# Altium schematic sheet Robot_POWER.schdoc
size 594 x 420 mm; Symbol: Sheet-Symbol_A4; Device: Sheet-Symbol_A4; Company: 嘉立创EDA; Version: V1.0; Page Size: A4; @Project Name: Power_Board2.0_布局; @Page Count: 1; @Update Date: 2025-11-04; @Create Date: 2025-11-04; @Schematic Name: Schematic1_1; @Page No: 1; @Page Name: P1; Width: 1655; Height: 1170; @Board Name: Board1; Blade Width: 10; @Create Time: 12:11:19; @Update Time: 19:38:18; Region Start: 1; X Region Count: 6; Y Region Count: 4; Title Block Position: 3; SheetNumber: 1; SheetTotal: 1
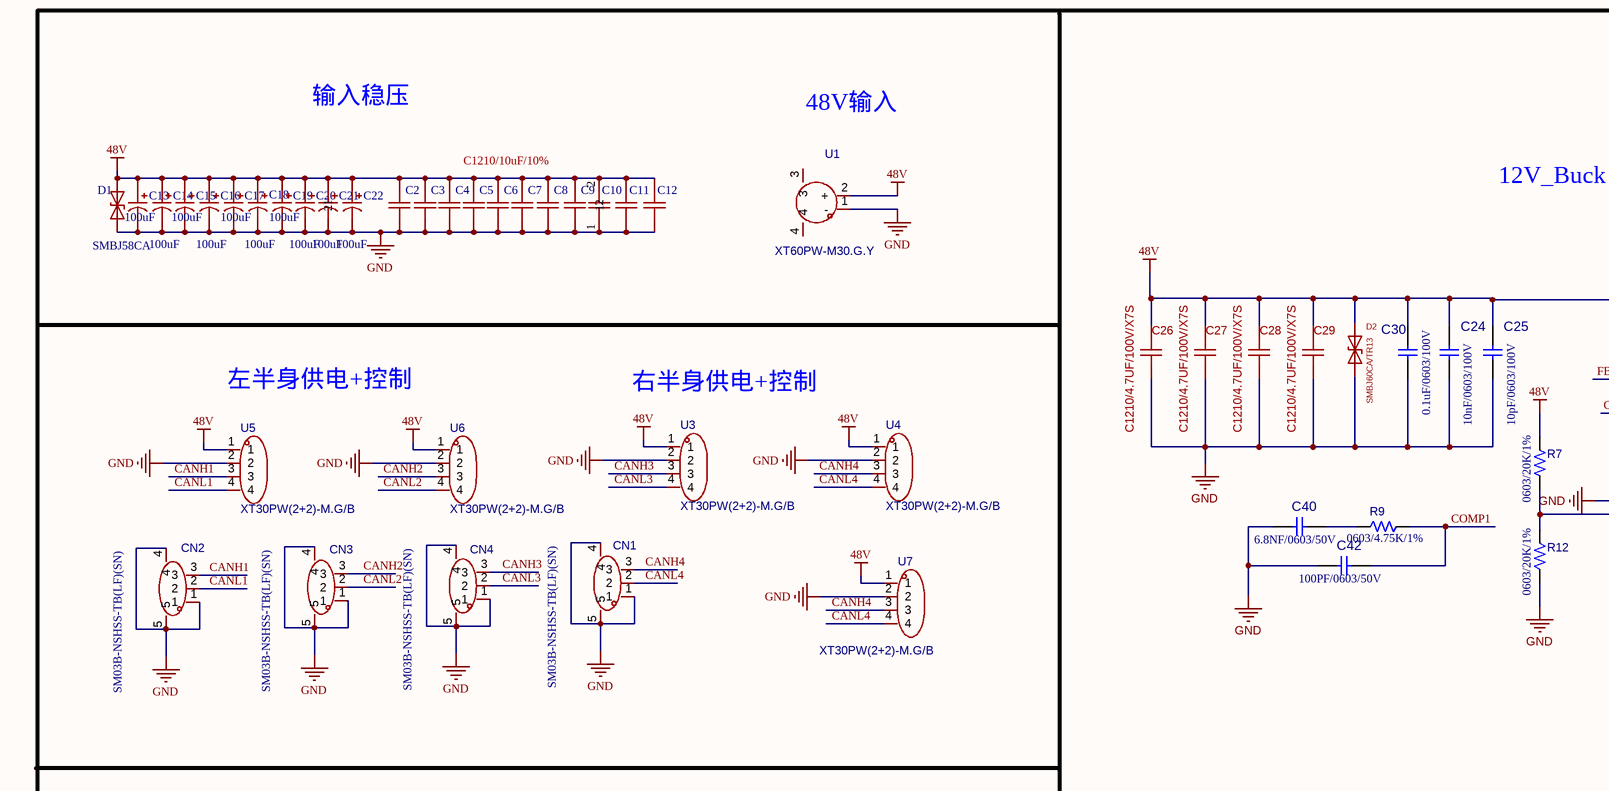
[diagram p0: Robot_POWER.schdoc, top left]
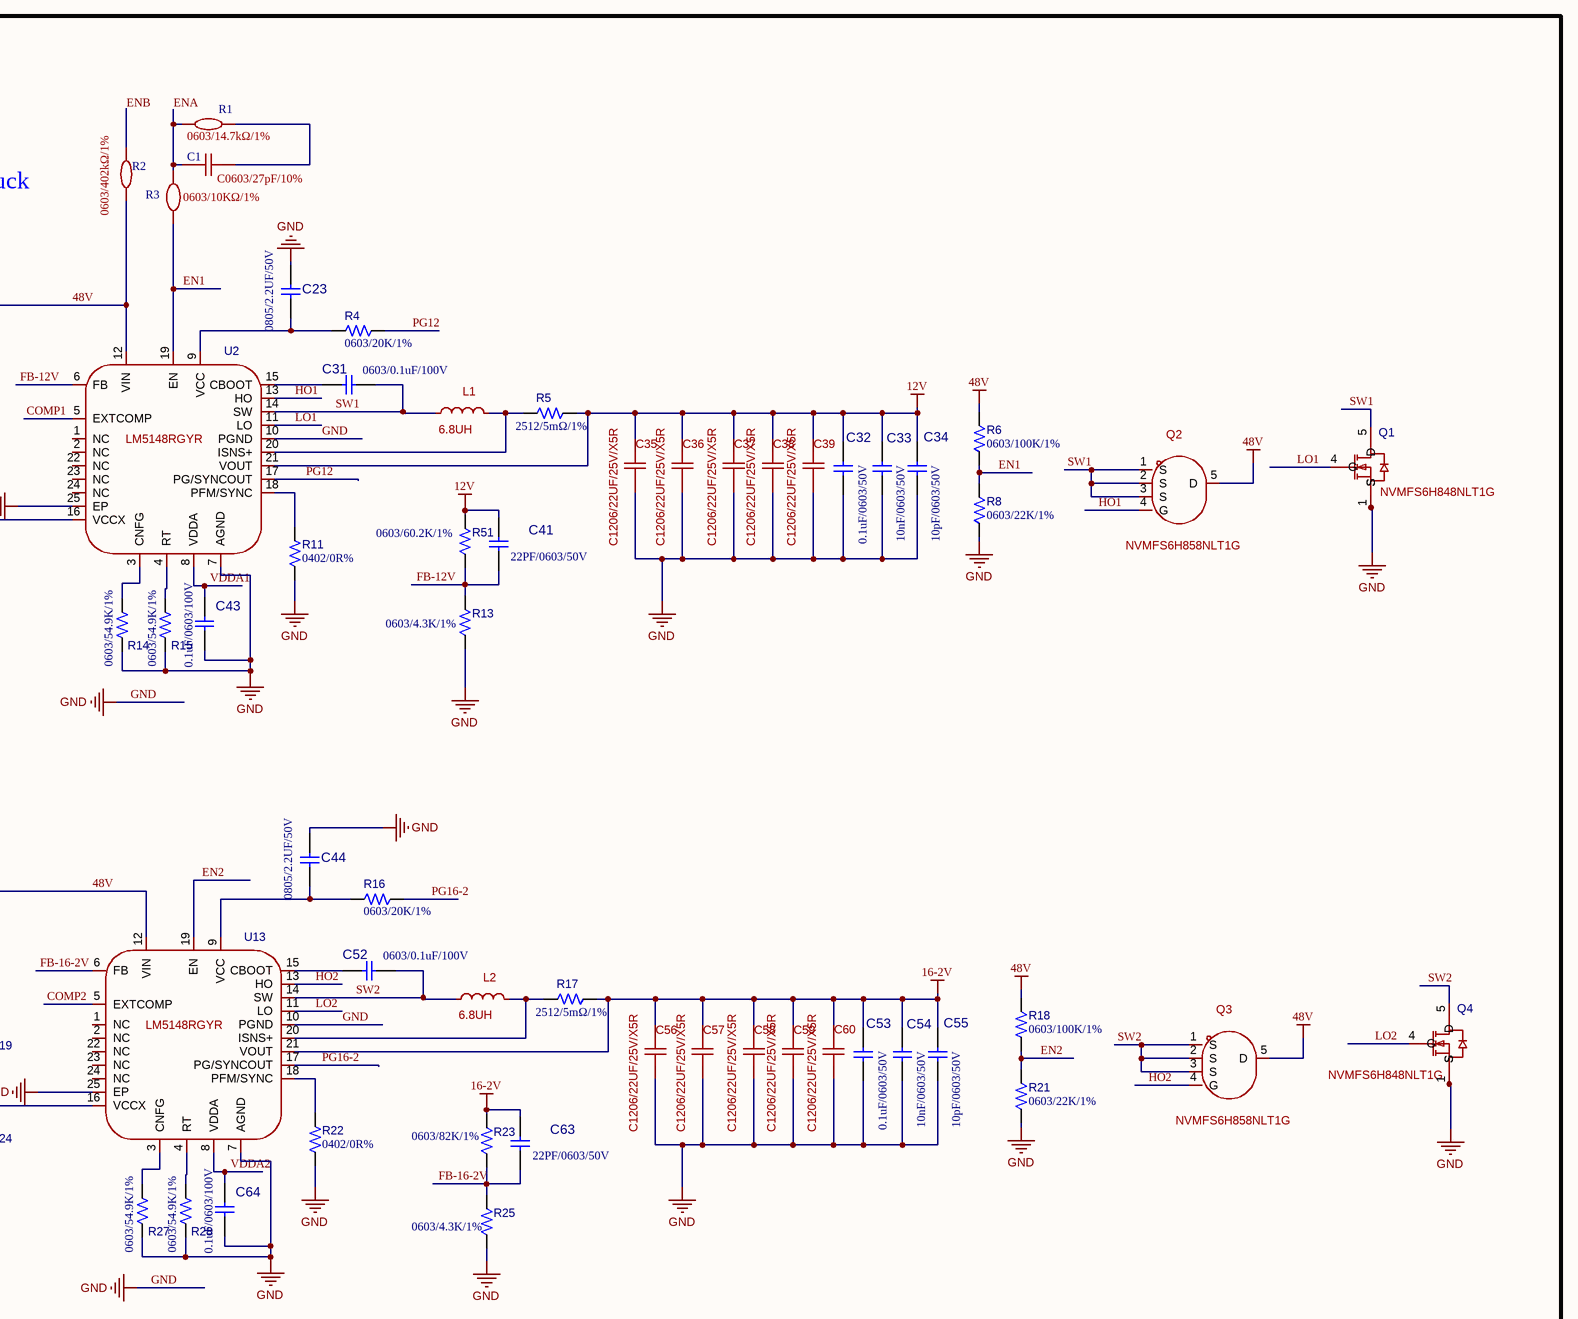
[diagram p1: Robot_POWER.schdoc, top right]
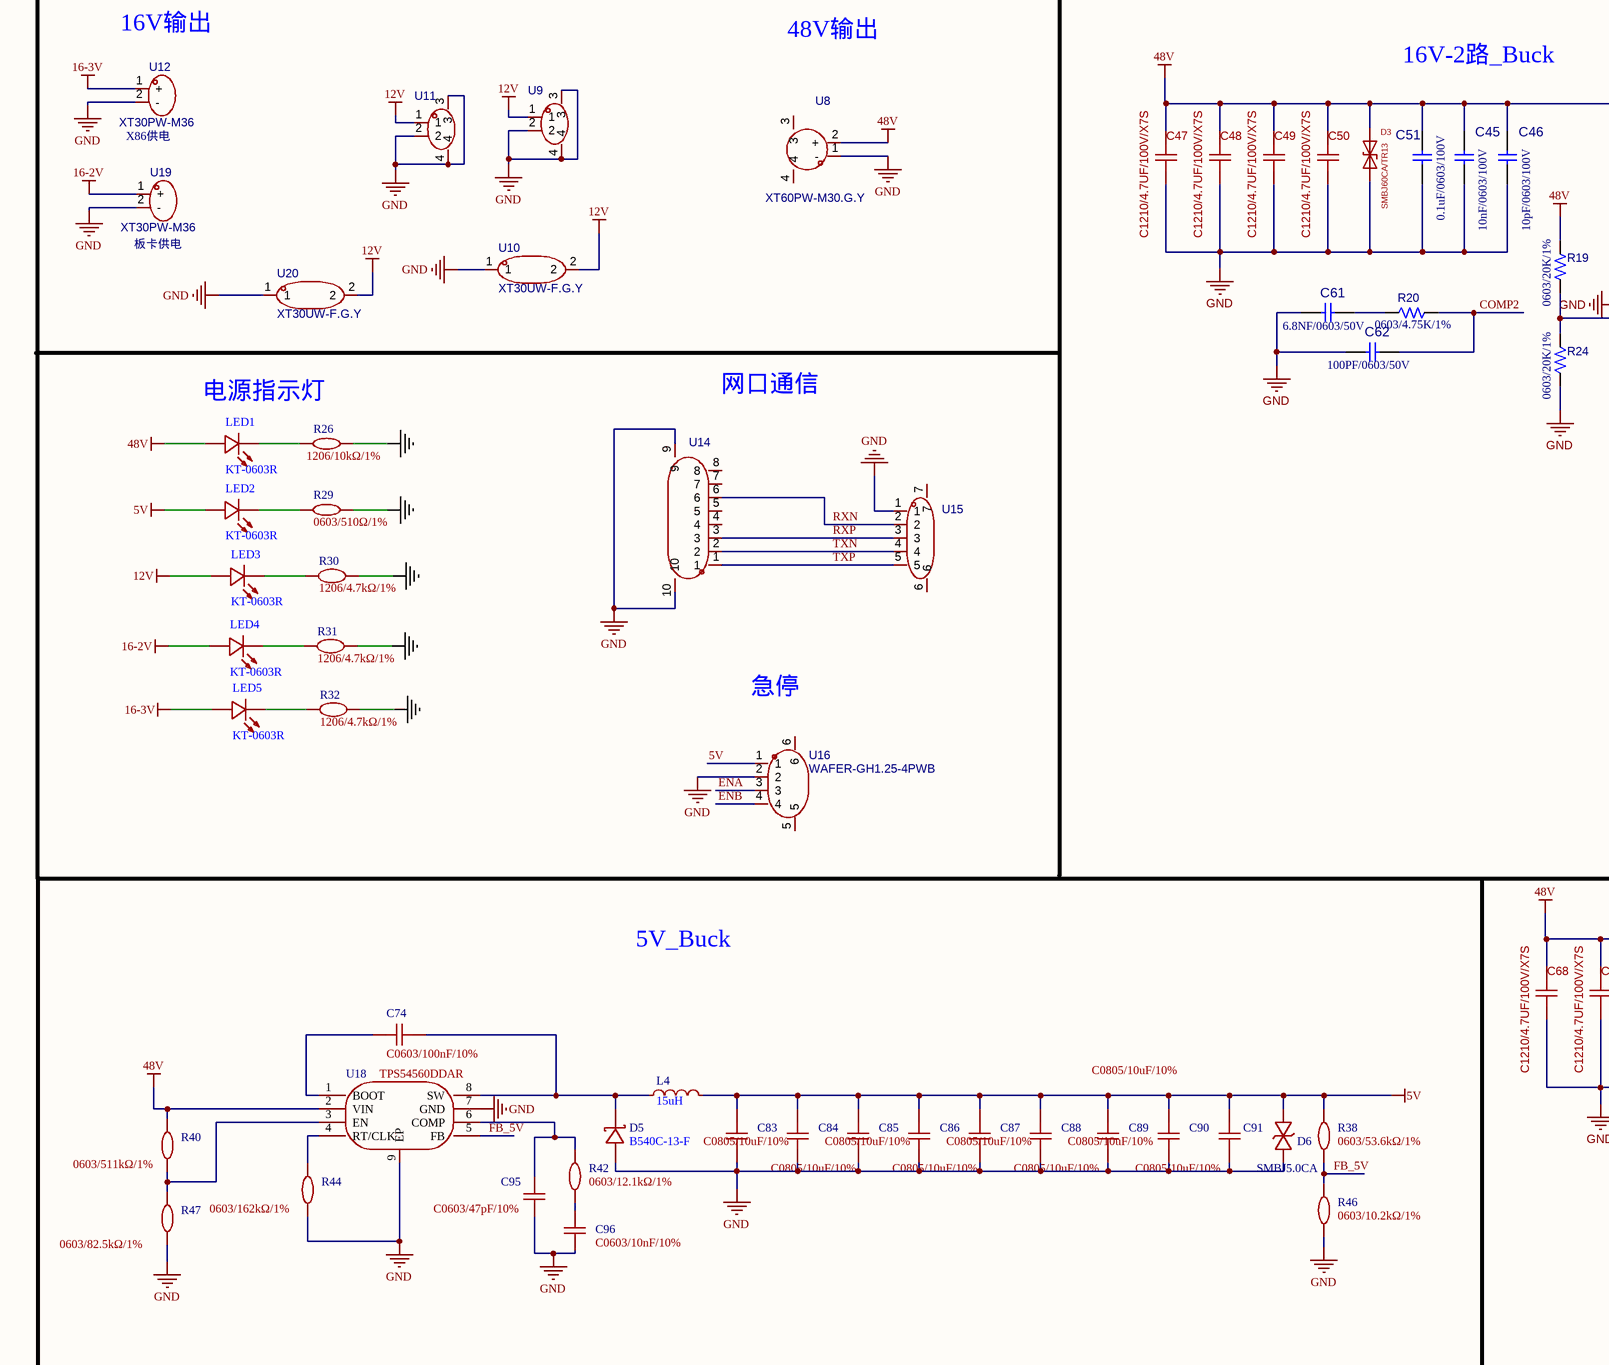
[diagram p2: Robot_POWER.schdoc, bottom left]
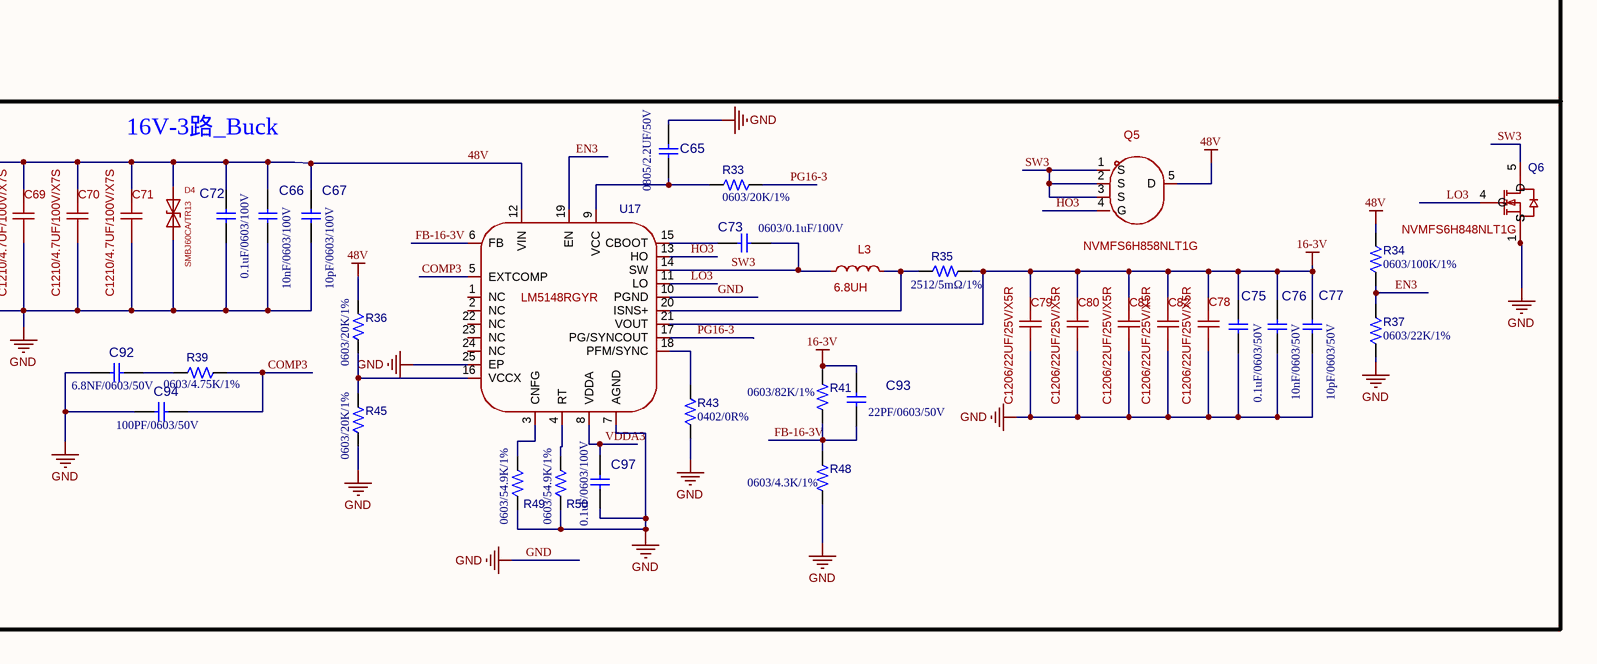
[diagram p3: Robot_POWER.schdoc, bottom right]

## Parts
C1  C0603/27pF/10%  [C0603]
C2  C1210/10uF/10%  [C1210]  (value not drawn)
C3  C1210/10uF/10%  [C1210]  (value not drawn)
C4  C1210/10uF/10%  [C1210]  (value not drawn)
C5  C1210/10uF/10%  [C1210]  (value not drawn)
C6  C1210/10uF/10%  [C1210]  (value not drawn)
C7  C1210/10uF/10%  [C1210]  (value not drawn)
C8  C1210/10uF/10%  [C1210]
C9  C1210/10uF/10%  [c1210]  (value not drawn)
C10  C1210/10uF/10%  [C1210]  (value not drawn)
C11  C1210/10uF/10%  [C1210]  (value not drawn)
C12  C1210/10uF/10%  [C1210]  (value not drawn)
C13  100uF  [CAP-TH_BD10.0-P5.00-D0.6-FD_2]
C14  100uF  [CAP-TH_BD10.0-P5.00-D0.6-FD_2]
C15  100uF  [CAP-TH_BD10.0-P5.00-D0.6-FD_2]
C16  100uF  [CAP-TH_BD10.0-P5.00-D0.6-FD_2]
C17  100uF  [CAP-TH_BD10.0-P5.00-D0.6-FD_2]
C18  100uF  [CAP-TH_BD10.0-P5.00-D0.6-FD_2]
C19  100uF  [CAP-TH_BD10.0-P5.00-D0.6-FD_2]
C20  100uF  [CAP-TH_BD10.0-P5.00-D0.6-FD_2]
C21  100uF  [CAP-TH_BD10.0-P5.00-D0.6-FD_2]
C22  100uF  [CAP-TH_BD10.0-P5.00-D0.6-FD_2]
C23  0805/2.2UF/50V  [C0805]
C24  10nF/0603/100V  [C0603]
C25  10pF/0603/100V  [C0603]
C26  C1210/4.7UF/100V/X7S  [C1210]
C27  C1210/4.7UF/100V/X7S  [C1210]
C28  C1210/4.7UF/100V/X7S  [C1210]
C29  C1210/4.7UF/100V/X7S  [C1210]
C30  0.1uF/0603/100V  [C0603]
C31  0603/0.1uF/100V  [C0402]
C32  0.1uF/0603/50V  [C0603]
C33  10nF/0603/50V  [C0603]
C34  10pF/0603/50V  [C0603]
C35  C1206/22UF/25V/X5R  [C1206]
C36  C1206/22UF/25V/X5R  [C1206]
C37  C1206/22UF/25V/X5R  [C1206]
C38  C1206/22UF/25V/X5R  [C1206]
C39  C1206/22UF/25V/X5R  [C1206]
C40  6.8NF/0603/50V  [C0603]
C41  22PF/0603/50V  [C0603]
C42  100PF/0603/50V  [C0603]
C43  0.1uF/0603/100V  [C0603]
C44  0805/2.2UF/50V  [C0805]
C45  10nF/0603/100V  [C0603]
C46  10pF/0603/100V  [C0603]
C47  C1210/4.7UF/100V/X7S  [C1210]
C48  C1210/4.7UF/100V/X7S  [C1210]
C49  C1210/4.7UF/100V/X7S  [C1210]
C50  C1210/4.7UF/100V/X7S  [C1210]
C51  0.1uF/0603/100V  [C0603]
C52  0603/0.1uF/100V  [C0402]
C53  0.1uF/0603/50V  [C0603]
C54  10nF/0603/50V  [C0603]
C55  10pF/0603/50V  [C0603]
C56  C1206/22UF/25V/X5R  [C1206]
C57  C1206/22UF/25V/X5R  [C1206]
C58  C1206/22UF/25V/X5R  [C1206]
C59  C1206/22UF/25V/X5R  [C1206]
C60  C1206/22UF/25V/X5R  [C1206]
C61  6.8NF/0603/50V  [C0603]
C62  100PF/0603/50V  [C0603]
C63  22PF/0603/50V  [C0603]
C64  0.1uF/0603/100V  [C0603]
C65  0805/2.2UF/50V  [C0805]
C66  10nF/0603/100V  [C0603]
C67  10pF/0603/100V  [C0603]
C68  C1210/4.7UF/100V/X7S  [C1210]
C69  C1210/4.7UF/100V/X7S  [C1210]
C70  C1210/4.7UF/100V/X7S  [C1210]
C71  C1210/4.7UF/100V/X7S  [C1210]
C72  0.1uF/0603/100V  [C0603]
C73  0603/0.1uF/100V  [C0402]
C74  C0603/100nF/10%  [C0603]
C75  0.1uF/0603/50V  [C0603]
C76  10nF/0603/50V  [C0603]
C77  10pF/0603/50V  [C0603]
C78  C1206/22UF/25V/X5R  [C1206]
C79  C1206/22UF/25V/X5R  [C1206]
C80  C1206/22UF/25V/X5R  [C1206]
C81  C1206/22UF/25V/X5R  [C1206]
C82  C1206/22UF/25V/X5R  [C1206]
C83  C0805/10uF/10%  [C0805]
C84  C0805/10uF/10%  [C0805]
C85  C0805/10uF/10%  [C0805]
C86  C0805/10uF/10%  [C0805]
C87  C0805/10uF/10%  [C0805]
C88  C0805/10uF/10%  [C0805]
C89  C0805/10uF/10%  [C0805]
C90  C0805/10uF/10%  [C0805]
C91  C0805/10uF/10%  [C0805]
C92  6.8NF/0603/50V  [C0603]
C93  22PF/0603/50V  [C0603]
C94  100PF/0603/50V  [C0603]
C95  C0603/47pF/10%  [C0603]
C96  C0603/10nF/10%  [C0603]
C97  0.1uF/0603/100V  [C0603]
CN1  SM03B-NSHSS-TB(LF)(SN)  [CONN-SMD_3P-P1.00_BM03B-NSHSS-TBT]  (value not drawn)
CN2  SM03B-NSHSS-TB(LF)(SN)  [CONN-SMD_3P-P1.00_BM03B-NSHSS-TBT]  (value not drawn)
CN3  SM03B-NSHSS-TB(LF)(SN)  [CONN-SMD_3P-P1.00_BM03B-NSHSS-TBT]  (value not drawn)
CN4  SM03B-NSHSS-TB(LF)(SN)  [CONN-SMD_3P-P1.00_BM03B-NSHSS-TBT]  (value not drawn)
D1  SMBJ58CA  [SMB_L4.5-W3.6-LS5.2-BI]
D2  SMBJ60CA/TR13  [SMB_L4.3-W3.6-LS5.4-BI]
D3  SMBJ60CA/TR13  [SMB_L4.3-W3.6-LS5.4-BI]
D4  SMBJ60CA/TR13  [SMB_L4.3-W3.6-LS5.4-BI]
D5  B540C-13-F  [SMC_L7.1-W6.2-LS8.1-RD]
D6  SMBJ5.0CA  [SMB_L4.5-W3.6-LS5.2-BI]
L1  6.8UH  [IND-SMD_L12.8-W12.8-LS13.8_CYA1265]
L2  6.8UH  [IND-SMD_L12.8-W12.8-LS13.8_CYA1265]
L3  6.8UH  [IND-SMD_L12.8-W12.8-LS13.8_CYA1265]
L4  15uH  [IND-SMD_L7.0-W6.6]
LED1  KT-0603R  [LED0603-RD_RED]
LED2  KT-0603R  [LED0603-RD_RED]
LED3  KT-0603R  [LED0603-RD_RED]
LED4  KT-0603R  [LED0603-RD_RED]
LED5  KT-0603R  [LED0603-RD_RED]
Q1  NVMFS6H848NLT1G  [DFN-5_L4.9-W5.9-P1.27-LS6.2-BL]
Q2  NVMFS6H858NLT1G  [DFN-5_L4.9-W5.9-P1.27-LS6.2-BL]
Q3  NVMFS6H858NLT1G  [DFN-5_L4.9-W5.9-P1.27-LS6.2-BL]
Q4  NVMFS6H848NLT1G  [DFN-5_L4.9-W5.9-P1.27-LS6.2-BL]
Q5  NVMFS6H858NLT1G  [DFN-5_L4.9-W5.9-P1.27-LS6.2-BL]
Q6  NVMFS6H848NLT1G  [DFN-5_L4.9-W5.9-P1.27-LS6.2-BL]
R1  0603/14.7kΩ/1%  [R0603]
R2  0603/402kΩ/1%  [R0603]
R3  0603/10KΩ/1%  [R0603]
R4  0603/20K/1%  [R0603]
R5  2512/5mΩ/1%  [R2512]
R6  0603/100K/1%  [R0603]
R7  0603/20K/1%  [R0603]
R8  0603/22K/1%  [R0603]
R9  0603/4.75K/1%  [R0603]
R11  0402/0R%  [R0402]
R12  0603/20K/1%  [R0603]
R13  0603/4.3K/1%  [R0603]
R14  0603/54.9K/1%  [R0603]
R15  0603/54.9K/1%  [R0603]
R16  0603/20K/1%  [R0603]
R17  2512/5mΩ/1%  [R2512]
R18  0603/100K/1%  [R0603]
R19  0603/20K/1%  [R0603]
R20  0603/4.75K/1%  [R0603]
R21  0603/22K/1%  [R0603]
R22  0402/0R%  [R0402]
R23  0603/82K/1%  [R0603]
R24  0603/20K/1%  [R0603]
R25  0603/4.3K/1%  [R0603]
R26  1206/10kΩ/1%  [R1206]
R27  0603/54.9K/1%  [R0603]
R28  0603/54.9K/1%  [R0603]
R29  0603/510Ω/1%  [R0603]
R30  1206/4.7kΩ/1%  [R1206]
R31  1206/4.7kΩ/1%  [R1206]
R32  1206/4.7kΩ/1%  [R1206]
R33  0603/20K/1%  [R0603]
R34  0603/100K/1%  [R0603]
R35  2512/5mΩ/1%  [R2512]
R36  0603/20K/1%  [R0603]
R37  0603/22K/1%  [R0603]
R38  0603/53.6kΩ/1%  [R0603]
R39  0603/4.75K/1%  [R0603]
R40  0603/511kΩ/1%  [R0603]
R41  0603/82K/1%  [R0603]
R42  0603/12.1kΩ/1%  [R0603]
R43  0402/0R%  [R0402]
R44  0603/162kΩ/1%  [R0603]
R45  0603/20K/1%  [R0603]
R46  0603/10.2kΩ/1%  [R0603]
R47  0603/82.5kΩ/1%  [R0603]
R48  0603/4.3K/1%  [R0603]
R49  0603/54.9K/1%  [R0603]
R50  0603/54.9K/1%  [R0603]
R51  0603/60.2K/1%  [R0603]
U1  XT60PW-M30.G.Y  [CONN-TH_XT60PW-M]
U2  LM5148RGYR  [VQFN-24_L5.5-W3.5-P0.50-BL-EP-2]
U3  XT30PW(2+2)-M.G/B  [CONN-TH_4P-XT30PW-M]
U4  XT30PW(2+2)-M.G/B  [CONN-TH_4P-XT30PW-M]
U5  XT30PW(2+2)-M.G/B  [CONN-TH_4P-XT30PW-M]
U6  XT30PW(2+2)-M.G/B  [CONN-TH_4P-XT30PW-M]
U7  XT30PW(2+2)-M.G/B  [CONN-TH_4P-XT30PW-M]
U8  XT60PW-M30.G.Y  [CONN-TH_XT60PW-M]
U9  CONN-SMD_2053380002  [CONN-SMD_2053380002]  (value not drawn)
U10  XT30UW-F.G.Y  [CONN-TH_XT30UW-F.G.Y]
U11  CONN-SMD_2053380002  [CONN-SMD_2053380002]  (value not drawn)
U12  XT30PW-M36  [CONN-TH_2P-P5.00_XT30PW-M36]
U13  LM5148RGYR  [VQFN-24_L5.5-W3.5-P0.50-BL-EP-2]
U14  bx-ph2.0-8plt  [CONN-SMD_8P-P2.00_BX-PH2.0-8PLT]  (value not drawn)
U15  BX-SH1.0-5PLT  [CONN-SMD_5P-P1.00_BX-SH1.0-5PLT]  (value not drawn)
U16  WAFER-GH1.25-4PWB  [CONN-SMD_4P-P1.25_XUNPU_WAFER-GH1.25-4PWB]
U17  LM5148RGYR  [VQFN-24_L5.5-W3.5-P0.50-BL-EP-2]
U18  TPS54560DDAR  [SOIC-8_L5.0-W4.0-P1.27-LS6.0-BL-EP2.0]
U19  XT30PW-M36  [CONN-TH_2P-P5.00_XT30PW-M36]
U20  XT30UW-F.G.Y  [CONN-TH_XT30UW-F.G.Y]

## Nets
5V: C83.2 C84.2 C85.2 C86.2 C87.2 C88.2 C89.2 C90.2 C91.2 D6.2 L4.2 LED2.2(A) R38.2 U16.1
12V: C32.2 C33.2 C34.2 C35.1 C36.1 C37.1 C38.1 C39.1 C41.1 LED3.2(A) R5.1 R51.1 U2.21(VOUT) U9.1 U10.2 U11.1 U20.2
16-2V: C53.2 C54.2 C55.2 C56.1 C57.1 C58.1 C59.1 C60.1 C63.1 LED4.2(A) R17.1 R23.1 U13.21(VOUT) U19.1(+)
16-3V: C75.2 C76.2 C77.2 C78.1 C79.1 C80.1 C81.1 C82.1 C93.1 LED5.2(A) R35.1 R41.1 U12.1(+) U17.21(VOUT)
48V: C2.2 C3.2 C4.2 C5.2 C6.2 C7.2 C8.2 C9.2 C10.2 C11.2 C12.2 C13.1 C14.1 C15.1 C16.1 C17.1 C18.1 C19.1 C20.1 C21.1 C22.1 C24.2 C25.2 C26.1 C27.1 C28.1 C29.1 C30.2 C45.2 C46.2 C47.1 C48.1 C49.1 C50.1 C51.2 C66.2 C67.2 C68.1 C69.1 C70.1 C71.1 C72.2 D1.1(K) D2.1(K) D3.1(K) D4.1(K) LED1.2(A) Q2.5(D) Q3.5(D) Q5.5(D) R2.2 R6.1 R7.2 R18.1 R19.2 R34.1 R36.2 R40.2 U1.2(+) U2.12(VIN) U3.1 U4.1 U5.1 U6.1 U7.1 U8.2(+) U13.12(VIN) U17.12(VIN) U18.2(VIN)
GND: C2.1 C3.1 C4.1 C5.1 C6.1 C7.1 C8.1 C9.1 C10.1 C11.1 C12.1 C13.2 C14.2 C15.2 C16.2 C17.2 C18.2 C19.2 C20.2 C21.2 C22.2 C23.2 C24.1 C25.1 C26.2 C27.2 C28.2 C29.2 C30.1 C32.1 C33.1 C34.1 C35.2 C36.2 C37.2 C38.2 C39.2 C40.2 C42.2 C43.1 C44.2 C45.1 C46.1 C47.2 C48.2 C49.2 C50.2 C51.1 C53.1 C54.1 C55.1 C56.2 C57.2 C58.2 C59.2 C60.2 C61.2 C62.2 C64.1 C65.2 C66.1 C67.1 C68.2 C69.2 C70.2 C71.2 C72.1 C75.1 C76.1 C77.1 C78.2 C79.2 C80.2 C81.2 C82.2 C83.1 C84.1 C85.1 C86.1 C87.1 C88.1 C89.1 C90.1 C91.1 C92.2 C94.2 C95.1 C96.1 C97.1 CN1.1 CN1.4 CN1.5 CN2.1 CN2.4 CN2.5 CN3.1 CN3.4 CN3.5 CN4.1 CN4.4 CN4.5 D1.2(A) D2.2(A) D3.2(A) D4.2(A) D5.2(A) D6.1 Q1.1(S) Q1.2(S) Q1.3(S) Q4.1(S) Q4.2(S) Q4.3(S) Q6.1(S) Q6.2(S) Q6.3(S) R8.2 R11.2 R12.1 R13.2 R14.2 R15.2 R21.2 R22.2 R24.1 R25.2 R26.2 R27.2 R28.2 R29.2 R30.2 R31.2 R32.2 R37.2 R43.2 R44.1 R45.1 R46.1 R47.1 R48.2 R49.2 R50.2 U1.1(-) U2.7(AGND) U2.10(PGND) U2.25(EP) U3.2 U4.2 U5.2 U6.2 U7.2 U8.1(-) U9.2 U9.3 U9.4 U10.1 U11.2 U11.3 U11.4 U12.2(-) U13.7(AGND) U13.10(PGND) U13.25(EP) U14.9 U14.10 U15.1 U16.2 U17.7(AGND) U17.10(PGND) U17.25(EP) U18.7(GND) U18.9(EP) U19.2(-) U20.1
CANH1: CN2.3 U5.3
CANH2: CN3.3 U6.3
CANH3: CN4.3 U3.3
CANH4: CN1.3 U4.3 U7.3
CANL1: CN2.2 U5.4
CANL2: CN3.2 U6.4
CANL3: CN4.2 U3.4
CANL4: CN1.2 U4.4 U7.4
COMP1: C42.1 R9.1 U2.5(EXTCOMP)
COMP2: C62.1 R20.1 U13.5(EXTCOMP)
COMP3: C94.1 R39.1 U17.5(EXTCOMP)
EN1: R3.1 R6.2 R8.1 U2.19(EN)
EN2: R18.2 R21.1 U13.19(EN)
EN3: R34.2 R37.1 U17.19(EN)
ENA: C1.1 R1.2 R3.2 U16.3
ENB: R2.1 U16.4
FB-12V: C41.2 R13.1 R51.2 U2.6(FB)
FB-16-2V: C63.2 R23.2 R25.1 U13.6(FB)
FB-16-3V: C93.2 R41.2 R48.1 U17.6(FB)
FB_5V: R38.1 R46.2 U18.5(FB)
HO1: Q2.4(G) U2.13(HO)
HO2: Q3.4(G) U13.13(HO)
HO3: Q5.4(G) U17.13(HO)
LO1: Q1.4(G) U2.11(LO)
LO2: Q4.4(G) U13.11(LO)
LO3: Q6.4(G) U17.11(LO)
PG12: R4.1 U2.17(PG/SYNCOUT)
PG16-2: R16.1 U13.17(PG/SYNCOUT)
PG16-3: R33.1 U17.17(PG/SYNCOUT)
RXN: U14.6 U15.2
RXP: U14.3 U15.3
SW1: C31.1 L1.1 Q1.5(D) Q2.1(S) Q2.2(S) Q2.3(S) U2.14(SW)
SW2: C52.1 L2.1 Q3.1(S) Q3.2(S) Q3.3(S) Q4.5(D) U13.14(SW)
SW3: C73.1 L3.1 Q5.1(S) Q5.2(S) Q5.3(S) Q6.5(D) U17.14(SW)
TXN: U14.2 U15.4
TXP: U14.1 U15.5
VDDA1: C43.2 U2.8(VDDA)
VDDA2: C64.2 U13.8(VDDA)
VDDA3: C97.2 U17.8(VDDA)
NetC1_2: C1.2 R1.1
NetC23_1: C23.1 R4.2 U2.9(VCC)
NetC31_2: C31.2 U2.15(CBOOT)
NetC40_1: C40.1 R9.2
NetC44_1: C44.1 R16.2 U13.9(VCC)
NetC52_2: C52.2 U13.15(CBOOT)
NetC61_1: C61.1 R20.2
NetC65_1: C65.1 R33.2 U17.9(VCC)
NetC73_2: C73.2 U17.15(CBOOT)
NetC74_1: C74.1 U18.1(BOOT)
NetC74_2: C74.2 D5.1(K) L4.1 U18.8(SW)
NetC92_1: C92.1 R39.2
NetC95_2: C95.2 R42.2 U18.6(COMP)
NetC96_2: C96.2 R42.1
NetL1_2: L1.2 R5.2 U2.20(ISNS+)
NetL2_2: L2.2 R17.2 U13.20(ISNS+)
NetL3_2: L3.2 R35.2 U17.20(ISNS+)
NetLED1_1: LED1.1(K) R26.1
NetLED2_1: LED2.1(K) R29.1
NetLED3_1: LED3.1(K) R30.1
NetLED4_1: LED4.1(K) R31.1
NetLED5_1: LED5.1(K) R32.1
NetR7_1: R7.1 R12.2 U2.16(VCCX)
NetR11_1: R11.1 U2.18(PFM/SYNC)
NetR14_1: R14.1 U2.3(CNFG)
NetR15_1: R15.1 U2.4(RT)
NetR19_1: R19.1 R24.2 U13.16(VCCX)
NetR22_1: R22.1 U13.18(PFM/SYNC)
NetR27_1: R27.1 U13.3(CNFG)
NetR28_1: R28.1 U13.4(RT)
NetR36_1: R36.1 R45.2 U17.16(VCCX)
NetR40_1: R40.1 R47.2 U18.3(EN)
NetR43_1: R43.1 U17.18(PFM/SYNC)
NetR44_2: R44.2 U18.4(RT/CLK)
NetR49_1: R49.1 U17.3(CNFG)
NetR50_1: R50.1 U17.4(RT)

Not connected (* = marked no-connect by the designer): U1 3 4; U2 1(NC) 2(NC) 22(NC) 23(NC) 24(NC); U8 3 4; U13 1(NC) 2(NC) 22(NC) 23(NC) 24(NC); U14 4 5 7 8; U15 6 7; U16 5 6; U17 1(NC) 2(NC) 22(NC) 23(NC) 24(NC)

## Notes on the sheet
- 输入稳压
- 48V输入
- 12V_Buck
- 左半身供电+控制
- (near U3) 右半身供电+控制
- (near CN2) SM03B-NSHSS-TB(LF)(SN)
- (near CN3) SM03B-NSHSS-TB(LF)(SN)
- (near CN4) SM03B-NSHSS-TB(LF)(SN)
- (near CN1) SM03B-NSHSS-TB(LF)(SN)
- (near U12) 16V输出
- 48V输出
- 16V-2路_Buck
- (near U12) X86供电
- (near U19) 板卡供电
- (near LED1) 电源指示灯
- 网口通信
- (near U16) 急停
- 16V-3路_Buck
- 5V_Buck
- DWG NO:
- REV:
- THIS DOCUMENT AND THE DATA DISCLOSED HEREIN OR
- HEREWITH IS THE PROPERTY OF ALTIUM LIMITED AND MAY
- BE FREELY DISTRIBUTED IN WHOLE. NO RIGHTS ARE
- RESERVED OR EXPRESS OR IMPLIED WARANTEE GIVEN.
- REVISION
- DESCRIPTION
- DATE
- APPROVED
- ENG:
- APPROVALS
- PROJECT
- DSN:
- CHK:
- REFERENCE DOCUMENTS
- PROJECT REVISION:
- TITLE
- DOCUMENT REVISION:
- DESIGN ITEM:
- BOM:
- FAB DWG:
- PCB DWG:
- ASSY DWG:
- SCALE:
- A2
- SIZE
- CAGE CODE
- FILE NAME
- DWG NO.
- SHEET
- OF
- REV

## Library data of the parts
C1 = CL10B104KB8NNNC: Symbol: CL10B104KB8NNNC
C2-C12 = FS32X106K101EGG: Manufacturer: PSA(信昌电陶); Value: 10uF; Tolerance: ±10%; Add into BOM: yes; Voltage Rated: 100V; Temperature Coefficient: X7R; Symbol: FS32X106K101EGG; Device: FS32X106K101EGG; Supplier: LCSC; Datasheet: https://atta.szlcsc.com/upload/public/pdf/source/20220906/2A42A90825742552985FFB5A7BAB200E.pdf; Supplier Part: C5156756; Convert to PCB: yes; LCSC Part Name: 10uF ±10% 100V; JLCPCB Part Class: 扩展库; Manufacturer Part: FS32X106K101EGG; Supplier Footprint: 1210
C13-C16 C19-C22 = PA100V100M10x12: C46550452; Manufacturer: JIERR(捷而瑞); Add into BOM: yes; Tolerance: ±20%; Voltage Rating: 100V; Ripple Current: 2.6A@100kHz; Equivalent Series Resistance(ESR): 40mΩ@100kHz; Type: 聚合物; Lifetime: 2000hrs@105℃; Symbol: PA100V100M10X12; Device: PA100V100M10x12; LCSC Part Name: 100uF ±20% 100V; Supplier Part: C46550452; Manufacturer Part: PA100V100M10x12; Supplier Footprint: 插件,D10xL12.5mm; JLCPCB Part Class: 扩展库; Datasheet: https://item.szlcsc.com/datasheet/PA100V100M10x12/48680146.html; Supplier: LCSC; Convert to PCB: yes; Value: 100uF; Diameter: 10mm; Height - Seated (Max): 12.5mm; Operating Temperature: -55℃~+105℃
C17 C18 = PA100V100M10x12: Manufacturer: JIERR(捷而瑞); Add into BOM: yes; Tolerance: ±20%; Voltage Rating: 100V; Ripple Current: 2.6A@100kHz; Equivalent Series Resistance(ESR): 40mΩ@100kHz; Type: 聚合物; Lifetime: 2000hrs@105℃; Symbol: PA100V100M10X12; Device: PA100V100M10x12; LCSC Part Name: 100uF ±20% 100V; Supplier Part: C46550452; Manufacturer Part: PA100V100M10x12; Supplier Footprint: 插件,D10xL12.5mm; JLCPCB Part Class: 扩展库; Datasheet: https://item.szlcsc.com/datasheet/PA100V100M10x12/48680146.html; Supplier: LCSC; Convert to PCB: yes; Value: 100uF; Diameter: 10mm; Height - Seated (Max): 12.5mm; Operating Temperature: -55℃~+105℃
C23 C31 C44 C52 C65 C73 = CAP2057: Capacitor; Manufacturer 1: AVX Corporation; Manufacturer Part Number 1: 04025A100JAT2A; Voltage: 50V; Description_: CAP CER 10pF 50V 5% NP0 SMD 0402; Dev Tools Status: Design; Tolerance: 5%; Temperature Coeffcient: 100ppm/C; Type: Ceramic; Owner: Ciprian Abramov; Populated: YES; MCHP-ID: CAP2057; Package: 0402; Revision: 1; Symbol: Capacitor NP; Status: MCL Design; ComponentLink1URL: https://chn-vm-apps.microchip.com/mchprepo/parts/Datasheets/C0GNP0-Dielectric.pdf; ComponentLink1Description: SVN Datasheet; ComponentLink2URL: C:\ALTIUM_WORK\00001_MCHP-CDB\Datasheets\C0GNP0-Dielectric.pdf; ComponentLink2Description: Local Datasheet; ComponentLink3URL: C:\ALTIUM_WORK\00001_MCHP-CDB\Library\LibraryRefs\Capacitor NP.SchLib; ComponentLink3Description: Open Symbol; ComponentLink4URL: C:\ALTIUM_WORK\00001_MCHP-CDB\Library\Footprints\CAP_C_0402.PcbLib; ComponentLink4Description: Open Footprint; ComponentLink5Description: Open Footprint 2; ComponentLink6Description: Open Footprint 3; ComponentLink7Description: Open Footprint 4; Operating Temperature: -55C to +125C; Category: Capacitor; Supplier 1: Digi-Key; Supplier Part Number 1: 478-1070-1-ND; Quantity Override: 1
C24 C25 C30 C32-C34 C40-C43 C45 C46 C51 C53-C55 C61-C64 C66 C67 C72 C75-C77 C92-C94 C97 = CAP0373: Capacitor; Manufacturer 1: Murata; Manufacturer Part Number 1: GRM21BR61C106KE15L; Voltage: 16V; Description_: CAP CER 10uF 16V 10% X5R SMD 0805; Tolerance: 10%; Temperature Coeffcient: X5R; Type: Ceramic; Populated: Yes; MCHP-ID: CAP0373; Package: 0805; Revision: 1; Status: Production; ComponentLink1URL: https://chn-vm-apps.microchip.com/mchprepo/parts/Datasheets/L0005E.pdf; ComponentLink1Description: Datasheet; Operating Temperature: +25C to +125C; Category: Capacitor; Manufacturer 2: Taiyo Yuden; Manufacturer Part Number 2: EMK212BJ106KG-T; Supplier 1: Digi-Key; Supplier Part Number 1: 490-3886-1-ND; Supplier 2: Digi-Key; Supplier Part Number 2: 587-1295-1-ND; Supplier 3: Newark; Supplier Part Number 3: 30K5459; Quantity Override: 1
C26-C29 C35-C39 C47-C50 C56-C60 C68-C71 C78-C82 = CGA6M3X7S2A475K200AE: Symbol: CGA6M3X7S2A475K200AE
C74 = CC0603KRX7R9BB104: Manufacturer: YAGEO(国巨); Value: 100nF; Tolerance: ±10%; Add into BOM: yes; Voltage Rated: 50V; Temperature Coefficient: X7R; Symbol: CC0603KRX7R9BB104; Device: CC0603KRX7R9BB104; Supplier: LCSC; Datasheet: https://atta.szlcsc.com/upload/public/pdf/source/20180910/C282072_33301C7F631E79921B82A8DAC6BCC5B3.pdf; Supplier Part: C14663; Convert to PCB: yes; LCSC Part Name: 100nF ±10% 50V; JLCPCB Part Class: 基础库; Manufacturer Part: CC0603KRX7R9BB104; Supplier Footprint: 0603
C83-C91 = CL21A106KBYQNNE: Manufacturer: SAMSUNG(三星); Value: 10uF; Tolerance: ±10%; Add into BOM: yes; Voltage Rated: 50V; Temperature Coefficient: X5R; Symbol: CL21A106KBYQNNE; Device: CL21A106KBYQNNE; Supplier: LCSC; Datasheet: https://atta.szlcsc.com/upload/public/pdf/source/20211217/EA547804C3DC63CB0E92325AB8B6CF61.pdf; Supplier Part: C2932476; Convert to PCB: yes; LCSC Part Name: 10uF ±10% 50V; JLCPCB Part Class: 扩展库; Manufacturer Part: CL21A106KBYQNNE; Supplier Footprint: 0805
C95 = CL10C470JB8NNNC: Manufacturer: SAMSUNG(三星); Value: 47pF; Tolerance: ±5%; Add into BOM: yes; Voltage Rated: 50V; Temperature Coefficient: C0G; Symbol: CL10C470JB8NNNC; Device: CL10C470JB8NNNC; Supplier: LCSC; Datasheet: https://atta.szlcsc.com/upload/public/pdf/source/20160218/1457707763339.pdf; Supplier Part: C1671; Convert to PCB: yes; LCSC Part Name: 47pF ±5% 50V; JLCPCB Part Class: 基础库; Manufacturer Part: CL10C470JB8NNNC; Supplier Footprint: 0603
C96 = CC0603KRX7R9BB103: Manufacturer: YAGEO(国巨); Value: 10nF; Tolerance: ±10%; Add into BOM: yes; Voltage Rated: 50V; Temperature Coefficient: X7R; Symbol: CC0603KRX7R9BB103; Device: CC0603KRX7R9BB103; Supplier: LCSC; Datasheet: https://atta.szlcsc.com/upload/public/pdf/source/20181008/C309510_22F155564471FAF6A489F7D68F34234E.pdf; Supplier Part: C100042; Convert to PCB: yes; LCSC Part Name: 10nF ±10% 50V; JLCPCB Part Class: 扩展库; Manufacturer Part: CC0603KRX7R9BB103; Supplier Footprint: 0603
D1 = SMBJ58CA: C151267; Manufacturer: Littelfuse(美国力特); Symbol: SMBJ58CA_C151267; Add into BOM: yes; Polarity: 双向; Reverse Stand-Off Voltage (Vrwm): 58V; Clamping Voltage: 93.6V; Peak Pulse Current (Ipp): 6.5A@10/1000us; Peak Pulse Power Dissipation (Ppp): 600W@10/1000us; Voltage - Breakdown: 71.2V; Reverse Leakage Current (Ir): 1uA; level of protection: IEC 61000-4-4；IEC 61000-4-2; Type: TVS; Device: SMBJ58CA; LCSC Part Name: 双向TVS 58V截止 峰值浪涌电流：6.5A@10/1000us; Supplier Part: C151267; Manufacturer Part: SMBJ58CA; Supplier Footprint: DO-214AA; JLCPCB Part Class: 扩展库; Datasheet: https://item.szlcsc.com/datasheet/SMBJ58CA/162607.html; Supplier: LCSC; Convert to PCB: yes; Operating Temperature: -65℃~+150℃
D2-D4 = SMBJ60CA/TR13: Manufacturer: Brightking(君耀电子); Symbol: SMBJ60CA_C309977; Add into BOM: yes; Reverse Stand-Off Voltage (Vrwm): 60V; Clamping Voltage: 96.8V; Peak Pulse Current (Ipp): 6.2A; Peak Pulse Power Dissipation (Ppp): 600W; Voltage - Breakdown: 66.7V; Type: TVS; Device: SMBJ60CA/TR13; LCSC Part Name: 60V截止 6.2A峰值脉冲; Supplier Part: C309977; Manufacturer Part: SMBJ60CA/TR13; Supplier Footprint: SMB(DO-214AA); JLCPCB Part Class: Extended Part; Datasheet: https://atta.szlcsc.com/upload/public/pdf/source/20181114/C309994_0BBF6B3C1D339796B104E4710E56EEA8.pdf; Supplier: LCSC; Convert to PCB: yes
D5 = B540C-13-F: Manufacturer: DIODES(美台); Add into BOM: yes; Reverse Voltage (Vr): 40V; Forward Voltage (Vf@If): 550mV@5A; Reverse Leakage Current (Ir): 500uA@40V; Average Rectified Current (Io): 5A; Symbol: B540C-13-F; Device: B540C-13-F; Supplier: LCSC; Datasheet: https://atta.szlcsc.com/upload/public/pdf/source/20171023/C134461_15087453602301052556.pdf; Supplier Part: C72264; Convert to PCB: yes; LCSC Part Name: 电压:40V 电流:5A; JLCPCB Part Class: 扩展库; Manufacturer Part: B540C-13-F; Supplier Footprint: SMC(DO-214AB)
D6 = SMBJ5.0CA_C19077559: C19077559; Manufacturer: R+O(宏嘉诚); Add into BOM: yes; Polarity: 双向; Reverse Stand-Off Voltage (Vrwm): 5V; Clamping Voltage: 9.2V; Peak Pulse Current (Ipp): 65.22A@10/1000us; Peak Pulse Power Dissipation (Ppp): 600W@10/1000us; Voltage - Breakdown: 7V; Reverse Leakage Current (Ir): 800uA; level of protection: IEC 61000-4-2; Type: TVS; Symbol: SMBJ5.0CA_C19077559; Device: SMBJ5.0CA_C19077559; LCSC Part Name: 双向TVS 5V截止 峰值浪涌电流：65.22A@10/1000us; Supplier Part: C19077559; Manufacturer Part: SMBJ5.0CA; Supplier Footprint: DO-214AA(SMB); JLCPCB Part Class: 扩展库; Datasheet: https://item.szlcsc.com/datasheet/SMBJ5.0CA/20275644.html; Supplier: LCSC; Convert to PCB: yes; Operating Temperature: -55℃~+150℃
L1-L3 = CYA1265-6.8UH: TDK_6.8UH_10A; Symbol: CYA1265-6.8UH
L4 = FXL0630-150-M: Manufacturer: cjiang(长江微电); Type: 一体成型电感; Tolerance: ±20%; Add into BOM: yes; Rated Current: 3A; DC Resistance (DCR): 115mΩ; Saturation Current (Isat): 4.5A; Symbol: FXL0630-150-M; Device: FXL0630-150-M; Value: 15uH; Supplier: LCSC; Datasheet: https://atta.szlcsc.com/upload/public/pdf/source/20240426/3189EA8206330E2108542F9E34E540E7.pdf; Supplier Part: C177243; Convert to PCB: yes; LCSC Part Name: 15uH ±20% 4.5A; JLCPCB Part Class: 扩展库; Manufacturer Part: FXL0630-150-M; Supplier Footprint: SMD,6.6x7mm
LED1-LED5 = KT-0603R: Manufacturer: KENTO; Add into BOM: yes; Emitted Color: 红色; Symbol: KT-0603R; Device: KT-0603R; Supplier: LCSC; Datasheet: https://atta.szlcsc.com/upload/public/pdf/source/20160616/1466072038404.pdf; Lens Color: -; Supplier Part: C2286; Viewing Angle: -; Convert to PCB: yes; LCSC Part Name: 0603 红灯 高亮; Mounting Sytle: -; Forward Current: -; Peak Wavelength: -; Color Temperature: -; JLCPCB Part Class: 基础库; Manufacturer Part: KT-0603R; Power Dissipation: -; Supplier Footprint: 0603; Diode Configuration: -; Dominant Wavelength: -; Operating Temperature: -40℃~+85℃
R1 = 0603WAF1472T5E: Manufacturer: UNI-ROYAL(厚声); Value: 14.7kΩ; Tolerance: ±1%; Add into BOM: yes; Power(Watts): 100mW; Overload Voltage (Max): 75V; Temperature Coefficient: ±100ppm/℃; Symbol: 0603WAF1472T5E; Device: 0603WAF1472T5E; Type: 厚膜电阻; Supplier: LCSC; Datasheet: https://atta.szlcsc.com/upload/public/pdf/source/20200306/C422600_1E6D84923E4A46A82E41ADD87F860B5C.pdf; Supplier Part: C22874; Convert to PCB: yes; LCSC Part Name: 14.7kΩ ±1% 100mW 厚膜电阻; JLCPCB Part Class: 扩展库; Manufacturer Part: 0603WAF1472T5E; Supplier Footprint: 0603; Operating Temperature Range: -55℃~+155℃
R2 = 0603WAF4023T5E: Manufacturer: UNI-ROYAL(厚声); Value: 402kΩ; Tolerance: ±1%; Add into BOM: yes; Power(Watts): 100mW; Overload Voltage (Max): 75V; Temperature Coefficient: ±100ppm/℃; Symbol: 0603WAF4023T5E; Device: 0603WAF4023T5E; Type: 厚膜电阻; Supplier: LCSC; Datasheet: https://atta.szlcsc.com/upload/public/pdf/source/20200306/C422600_1E6D84923E4A46A82E41ADD87F860B5C.pdf; Supplier Part: C23048; Convert to PCB: yes; LCSC Part Name: 402kΩ ±1% 100mW 厚膜电阻; JLCPCB Part Class: 扩展库; Manufacturer Part: 0603WAF4023T5E; Supplier Footprint: 0603; Operating Temperature Range: -55℃~+155℃
R3 = FRC0603F1002TS: Symbol: FRC0603F1002TS
R4-R9 R11-R25 R27 R28 R33-R37 R39 R41 R43 R45 R48-R51 = RSMT0001: Resistor; Manufacturer 1: Panasonic; Manufacturer Part Number 1: ERJ-3GSY0R00V; Description_: RES TKF 0R 1/10W SMD 0603; Power: 1/10W; Populated: Yes; MCHP-ID: RSMT0001; Package: 0603; Revision: 2; Status: Production; ComponentLink1URL: https://chn-vm-apps.microchip.com/mchprepo/parts/Datasheets/nrc.pdf; ComponentLink1Description: Datasheet; Operating Temperature: -55C to +155C; Category: Resistor; Type: RES SMD; Composition: TKF; Manufacturer 2: NIC Components; Manufacturer Part Number 2: NRC06Z0TRF; Manufacturer 3: Panasonic; Manufacturer Part Number 3: ERJ-3GEY0R00V; Manufacturer 4: Stackpole Electronics Inc; Manufacturer Part Number 4: RMCF0603ZT0R00; Manufacturer 5: Vishay; Manufacturer Part Number 5: CRCW06030000Z0EA; Manufacturer 6: Stackpole Electronics Inc; Manufacturer Part Number 6: RMCF 1/16 0 R; Manufacturer 7: Yageo; Manufacturer Part Number 7: RC0603JR-070RL; Manufacturer 8: KOA Speer; Manufacturer Part Number 8: RK73Z1JTTP; Manufacturer 9: ROHM; Manufacturer Part Number 9: MCR03EZPJ000; Supplier 2: NIC Components; Supplier Part Number 1: NRC06Z0TRF; Supplier 1: Digi-Key; Supplier Part Number 2: P0.0GTR-ND; Supplier 3: Digi-Key; Supplier Part Number 3: RMCF0603ZT0R00TR-ND; Supplier 4: Digi-Key; Supplier Part Number 4: RMCF0603ZT0R00CT-ND; Supplier 5: Digi-Key; Supplier Part Number 5: 541-0.0GCT-ND; Supplier 6: Digi-Key; Supplier Part Number 6: RMCF1/160RTR-ND; Supplier 7: Digi-Key; Supplier Part Number 7: 311-0.0GRCT-ND; Supplier 8: KOA Speer; Supplier Part Number 8: RK73Z1JTTP; Supplier 9: Digi-Key; Supplier Part Number 9: RHM0.0GCT-ND; Quantity Override: 1
R26 = 1206W4F1002T5E: Manufacturer: UNI-ROYAL(厚声); Value: 10kΩ; Tolerance: ±1%; Add into BOM: yes; Power(Watts): 250mW; Overload Voltage (Max): 200V; Temperature Coefficient: ±100ppm/℃; Symbol: 1206W4F1002T5E; Device: 1206W4F1002T5E; Type: 厚膜电阻; Supplier: LCSC; Datasheet: https://atta.szlcsc.com/upload/public/pdf/source/20200306/C422600_1E6D84923E4A46A82E41ADD87F860B5C.pdf; Supplier Part: C17902; Convert to PCB: yes; LCSC Part Name: 10kΩ ±1% 250mW 厚膜电阻; JLCPCB Part Class: 基础库; Manufacturer Part: 1206W4F1002T5E; Supplier Footprint: 1206; Operating Temperature Range: -55℃~+155℃
R29 = 0603WAF5100T5E: Manufacturer: UNI-ROYAL(厚声); Value: 510Ω; Tolerance: ±1%; Add into BOM: yes; Power(Watts): 100mW; Overload Voltage (Max): 75V; Temperature Coefficient: ±100ppm/℃; Symbol: 0603WAF5100T5E; Device: 0603WAF5100T5E; Supplier: LCSC; Manufacturer Part: 0603WAF5100T5E; Supplier Part: C23193; JLCPCB Part Class: 基础库; Type: 厚膜电阻; Datasheet: https://atta.szlcsc.com/upload/public/pdf/source/20200306/C422600_1E6D84923E4A46A82E41ADD87F860B5C.pdf; Convert to PCB: yes; LCSC Part Name: 510Ω ±1% 100mW 厚膜电阻; Supplier Footprint: 0603; Operating Temperature Range: -55℃~+155℃
R30-R32 = FRC1206J332 TS: Manufacturer: FOJAN(富捷); Value: 3.3kΩ; Tolerance: ±5%; Add into BOM: yes; Power(Watts): 250mW; Overload Voltage (Max): 200V; Temperature Coefficient: ±100ppm/℃; Symbol: FRC1206J332 TS; Device: FRC1206J332 TS; Type: 厚膜电阻; Supplier: LCSC; Datasheet: https://atta.szlcsc.com/upload/public/pdf/source/20211221/925EC7D7225764EE0046F22065062C87.pdf; Supplier Part: C2907469; Convert to PCB: yes; LCSC Part Name: 3.3kΩ ±5% 250mW 厚膜电阻; JLCPCB Part Class: 扩展库; Manufacturer Part: FRC1206J332 TS; Supplier Footprint: 1206; Operating Temperature Range: -55℃~+155℃
R38 = 0402WGF5362TCE: Manufacturer: UNI-ROYAL(厚声); Value: 53.6kΩ; Tolerance: ±1%; Add into BOM: yes; Power(Watts): 62.5mW; Overload Voltage (Max): 50V; Temperature Coefficient: ±100ppm/℃; Symbol: 0402WGF5362TCE; Device: 0402WGF5362TCE; Type: 厚膜电阻; Supplier: LCSC; Datasheet: https://atta.szlcsc.com/upload/public/pdf/source/20200306/C422600_1E6D84923E4A46A82E41ADD87F860B5C.pdf; Supplier Part: C53398; Convert to PCB: yes; LCSC Part Name: 53.6kΩ ±1% 62.5mW 厚膜电阻; JLCPCB Part Class: 扩展库; Manufacturer Part: 0402WGF5362TCE; Supplier Footprint: 0402; Operating Temperature Range: -55℃~+155℃
R40 = 0603WAF5113T5E: Manufacturer: UNI-ROYAL(厚声); Value: 511kΩ; Tolerance: ±1%; Add into BOM: yes; Power(Watts): 100mW; Overload Voltage (Max): 75V; Temperature Coefficient: ±100ppm/℃; Symbol: 0603WAF5113T5E; Device: 0603WAF5113T5E; Type: 厚膜电阻; Supplier: LCSC; Datasheet: https://atta.szlcsc.com/upload/public/pdf/source/20200306/C422600_1E6D84923E4A46A82E41ADD87F860B5C.pdf; Supplier Part: C23194; Convert to PCB: yes; LCSC Part Name: 511kΩ ±1% 100mW 厚膜电阻; JLCPCB Part Class: 扩展库; Manufacturer Part: 0603WAF5113T5E; Supplier Footprint: 0603; Operating Temperature Range: -55℃~+155℃
R42 = 0603WAF1212T5E: Manufacturer: UNI-ROYAL(厚声); Value: 12.1kΩ; Tolerance: ±1%; Add into BOM: yes; Power(Watts): 100mW; Overload Voltage (Max): 75V; Temperature Coefficient: ±100ppm/℃; Symbol: 0603WAF1212T5E; Device: 0603WAF1212T5E; Type: 厚膜电阻; Supplier: LCSC; Datasheet: https://atta.szlcsc.com/upload/public/pdf/source/20200306/C422600_1E6D84923E4A46A82E41ADD87F860B5C.pdf; Supplier Part: C22864; Convert to PCB: yes; LCSC Part Name: 12.1kΩ ±1% 100mW 厚膜电阻; JLCPCB Part Class: 扩展库; Manufacturer Part: 0603WAF1212T5E; Supplier Footprint: 0603; Operating Temperature Range: -55℃~+155℃
R44 = 0603WAF1623T5E: Manufacturer: UNI-ROYAL(厚声); Value: 162kΩ; Tolerance: ±1%; Add into BOM: yes; Power(Watts): 100mW; Overload Voltage (Max): 75V; Temperature Coefficient: ±100ppm/℃; Symbol: 0603WAF1623T5E; Device: 0603WAF1623T5E; Type: 厚膜电阻; Supplier: LCSC; Datasheet: https://atta.szlcsc.com/upload/public/pdf/source/20200306/C422600_1E6D84923E4A46A82E41ADD87F860B5C.pdf; Supplier Part: C22815; Convert to PCB: yes; LCSC Part Name: 162kΩ ±1% 100mW 厚膜电阻; JLCPCB Part Class: 扩展库; Manufacturer Part: 0603WAF1623T5E; Supplier Footprint: 0603; Operating Temperature Range: -55℃~+155℃
R46 = 0603WAF1022T5E: Manufacturer: UNI-ROYAL(厚声); Value: 10.2kΩ; Tolerance: ±1%; Add into BOM: yes; Power(Watts): 100mW; Overload Voltage (Max): 75V; Temperature Coefficient: ±100ppm/℃; Symbol: 0603WAF1022T5E; Device: 0603WAF1022T5E; Type: 厚膜电阻; Supplier: LCSC; Datasheet: https://atta.szlcsc.com/upload/public/pdf/source/20200306/C422600_1E6D84923E4A46A82E41ADD87F860B5C.pdf; Supplier Part: C22772; Convert to PCB: yes; LCSC Part Name: 10.2kΩ ±1% 100mW 厚膜电阻; JLCPCB Part Class: 扩展库; Manufacturer Part: 0603WAF1022T5E; Supplier Footprint: 0603; Operating Temperature Range: -55℃~+155℃
R47 = 0603WAF8252T5E: Manufacturer: UNI-ROYAL(厚声); Value: 82.5kΩ; Tolerance: ±1%; Add into BOM: yes; Power(Watts): 100mW; Overload Voltage (Max): 75V; Temperature Coefficient: ±100ppm/℃; Symbol: 0603WAF8252T5E; Device: 0603WAF8252T5E; Type: 厚膜电阻; Supplier: LCSC; Datasheet: https://atta.szlcsc.com/upload/public/pdf/source/20200306/C422600_1E6D84923E4A46A82E41ADD87F860B5C.pdf; Supplier Part: C23251; Convert to PCB: yes; LCSC Part Name: 82.5kΩ ±1% 100mW 厚膜电阻; JLCPCB Part Class: 扩展库; Manufacturer Part: 0603WAF8252T5E; Supplier Footprint: 0603; Operating Temperature Range: -55℃~+155℃
U1 U8 = XT60PW-M30.G.Y: AddInBom: yes; ModelId: 37912d55e50045169535334d164bae93聨0819f05c4eef4c71ace90d822a990e87; ModelTransform: 712.597,610.235,0,0,0,0,-161.417,0,-118.11; Symbol: XT60PW-M30.G.Y; Device: XT60PW-M30.G.Y; LCSC Part Name: XT60PW-M30.G.Y; SupplierPart: C7204007; ManufacturerPart: XT60PW-M30.G.Y; Supplier Footprint: 插件; JLCPCB Part Class: Extended Part; Supplier: LCSC; ConvertToPcb: yes; FootprintName: CONN-TH_XT60PW-M; ModelName: CONN-TH_XT60PW-M
U3-U7 = XT30PW(2+2)-M.G/B: AddInBom: yes; ModelId: f8fe1fea84414ff6ba064cb65694a64e聨0819f05c4eef4c71ace90d822a990e87; ModelTransform: 610.235,493.306,0,0,0,0,-6.772,-151.575,-78.74; Symbol: XT30PW(2+2)-M.G/B; Device: XT30PW(2+2)-M.G/B; LCSC Part Name: XT30PW(2+2)-M.G/B; SupplierPart: C19189446; ManufacturerPart: XT30PW(2+2)-M.G/B; Supplier Footprint: 插件; JLCPCB Part Class: Extended Part; Supplier: LCSC; ConvertToPcb: yes; FootprintName: CONN-TH_4P-XT30PW-M; ModelName: CONN-TH_4P-XT30PW-M
U9 U11 = 2053380002: Symbol: 2053380002
U10 U20 = XT30UW-F.G.Y: Manufacturer: AMASS(艾迈斯); AddInBom: yes; ModelId: b4d6908f3e7e4811a3e6138fa49d688c聨0819f05c4eef4c71ace90d822a990e87; ModelTransform: 401.574,202.7555,0,0,0,0,0,0,-118.11; Symbol: XT30UW-F.G.Y; Device: XT30UW-F.G.Y; LCSC Part Name: AMASS(艾迈斯)XT30UW防水锁扣镀金15A二芯母插头 母头XT30UW-F.G.Y; SupplierPart: C19268025; ManufacturerPart: XT30UW-F.G.Y; Supplier Footprint: -; JLCPCB Part Class: Extended Part; Datasheet: https://item.szlcsc.com/datasheet/XT30UW-F.G.Y/20526036.html; Supplier: LCSC; ConvertToPcb: yes; FootprintName: CONN-TH_XT30UW-F.G.Y; ModelName: CONN-TH_XT30UW-F.G.Y
U12 U19 = XT30PW-M36: AddInBom: yes; ModelId: 3acea756d5b2467796cb368fa64d4ccc聨0819f05c4eef4c71ace90d822a990e87; ModelTransform: 405.905,507.87304,0,0,0,0,-0.005,-224.409,-137.795; Symbol: XT30PW-M36; Device: XT30PW-M36; LCSC Part Name: XT30PW-M36; SupplierPart: C9900222726; ManufacturerPart: XT30PW-M36; Supplier Footprint: XT30; Supplier: LCSC; ConvertToPcb: yes; FootprintName: CONN-TH_2P-P5.00_XT30PW-M36; ModelName: CONN-TH_2P-P5.00_XT30PW-M36
U14 = bx-ph2.0-8plt: 插针结构:1x8P;间距:2mm;安装方式:立贴;参考系列:PH;总PIN数:8P;排数:1;每排PIN数:8;行距:-;额定电流:2A;触头材质:黄铜;触头镀层:锡;工作温度:-25℃~+85℃;; Manufacturer: Bossie(博锡); AddInBom: yes; ModelId: 14b3e0e37b864a5c9a0170aaaeedfe72; ModelTransform: 787.4,295.6687,0,0,0,0,0.001,-34.252,0; Pins Structure: 1x8P; Pitch: 2mm; Reference Series: PH; Number of PINs Per Row: 8; Current Rating: 2A; Voltage Rating: 250V; Plastic Material: LCP; Supplementary Features: 辅助焊脚; Z-Height of the Board: 6.3mm; X-Length of Bottom Edge on Board (Spacing Line): 20mm; Y-Width of Bottom Edge on Board: 7.5mm; Symbol: BX-PH2.0-8PLT; LCSC Part Name: 1x8P 间距:2mm 立贴 系列:PH; SupplierPart: C18077905; ManufacturerPart: BX-PH2.0-8PLT; Supplier Footprint: SMD,P=2mm; JLCPCB Part Class: Extended Part; Datasheet: https://item.szlcsc.com/datasheet/BX-PH2.0-8PLT/19218306.html; Supplier: LCSC; ConvertToPcb: yes; FootprintName: CONN-SMD_8P-P2.00_BX-PH2.0-8PLT; ModelName: CONN-SMD_8P-P2.00_BX-PH2.0-8PLT; Mounting Type: 立贴; Number of Pins: 8P; Number of Rows: 1; Row Spacing: -; Contact Material: 黄铜; Contact Plating: 锡; Operating Temperature: -25℃~+85℃; Flame Retardant Rating: -; Color: 米色
U16 = WAFER-GH1.25-4PWB: 插针结构:1x4P;间距:1.25mm;安装方式:卧贴;参考系列:GH;总PIN数:4P;排数:1;每排PIN数:4;行距:-;额定电流:1A;触头材质:黄铜;触头镀层:锡;工作温度:-25℃~+85℃;; Manufacturer: XUNPU(讯普); AddInBom: yes; ModelId: 7513cf7b15b743f8816b10e1669263ec聨0819f05c4eef4c71ace90d822a990e87; ModelTransform: 324.8025,196.85,0,0,0,0,0.001,-28.937,0; Pins Structure: 1x4P; Pitch: 1.25mm; Reference Series: GH; Number of PINs Per Row: 4; Current Rating: 1A; Voltage Rating: 125V; Plastic Material: LCP; Supplementary Features: 辅助焊脚; Z-Height of the Board: 4.35mm; X-Length of Bottom Edge on Board (Spacing Line): 8.25mm; Y-Width of Bottom Edge on Board: 5mm; Symbol: WAFER-GH1.25-4PWB; Device: WAFER-GH1.25-4PWB; LCSC Part Name: 1x4P 间距:1.25mm 卧贴 系列:GH; SupplierPart: C3029379; ManufacturerPart: WAFER-GH1.25-4PWB; Supplier Footprint: SMD,P=1.25mm,卧贴; JLCPCB Part Class: Extended Part; Datasheet: https://item.szlcsc.com/datasheet/WAFER-GH1.25-4PWB/3561391.html; Supplier: LCSC; ConvertToPcb: yes; FootprintName: CONN-SMD_4P-P1.25_XUNPU_WAFER-GH1.25-4PWB; ModelName: CONN-SMD_4P-P1.25_XUNPU_WAFER-GH1.25-4PWB; Mounting Type: 卧贴; Number of Pins: 4P; Number of Rows: 1; Row Spacing: -; Contact Material: 黄铜; Contact Plating: 锡; Operating Temperature: -25℃~+85℃; Flame Retardant Rating: -; Color: 米色
U18 = TPS54560DDAR: Manufacturer: TI(德州仪器); Function: 降压型; Topology: 降压式; Output Type: 可调; Add into BOM: yes; Input Voltage: 4.5V~60V; Output Voltage: 800mV~58.8V; Number of Outputs: 1; Switching Frequency: 2.5MHz; Output Current (Max): 5A; Synchronous Rectification: 否; Switch tube (built-in/external): 内置; Symbol: TPS54560DDAR; Device: TPS54560DDAR; Supplier: LCSC; Datasheet: https://www.ti.com/cn/lit/gpn/tps54560; Supplier Part: C31966; Convert to PCB: yes; LCSC Part Name: TPS54560DDAR; JLCPCB Part Class: 扩展库; Manufacturer Part: TPS54560DDAR; Supplier Footprint: SOIC-8-EP; Operating Temperature: -40℃~+150℃@(TJ)
CN1-CN4 = SM03B-NSHSS-TB(LF)(SN): Symbol: SM03B-NSHSS-TB(LF)(SN)
Q1 Q4 Q6 = NVMFS6H848NLT1G: Symbol: NVMFS6H848NLT1G
Q2 Q3 Q5 = NVMFS6H858NLT1G: Symbol: NVMFS6H858NLT1G
U2 U13 U17 = LM5148RGYR: Symbol: LM5148RGYR
U15 = BX-SH1.0-5PLT: Symbol: BX-SH1.0-5PLT